# Altium schematic sheet 03_TILT_REF.SchDoc
size A4; SheetNumber: 3; SheetTotal: 6
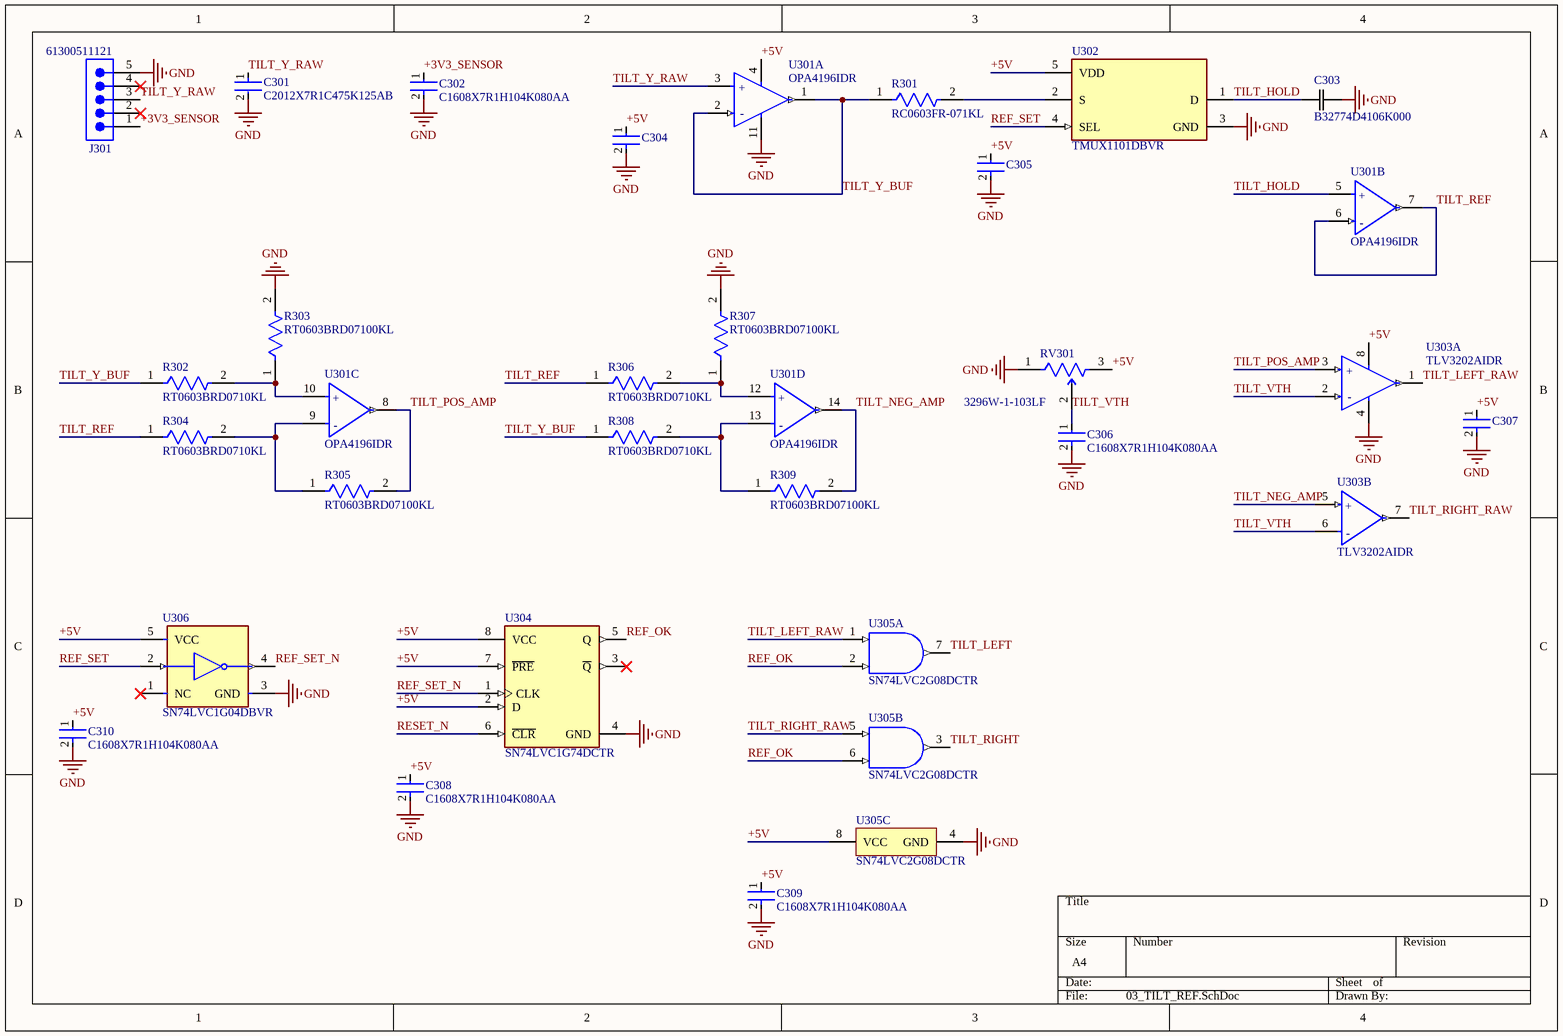
[diagram p0: 03_TILT_REF.SchDoc]

## Parts
C301  C2012X7R1C475K125AB  [FP-C2012-125-0_2-IPC_A]
C302  C1608X7R1H104K080AA  [FP-C1608-080-0_1-IPC_B]
C303  B32774D4106K000  [CAP_B32774D4106J000_TDK]
C304  C1608X7R1H104K080AA  [FP-C1608-080-0_1-IPC_B]  (value not drawn)
C305  C1608X7R1H104K080AA  [FP-C1608-080-0_1-IPC_B]  (value not drawn)
C306  C1608X7R1H104K080AA  [FP-C1608-080-0_1-IPC_B]
C307  C1608X7R1H104K080AA  [FP-C1608-080-0_1-IPC_B]  (value not drawn)
C308  C1608X7R1H104K080AA  [FP-C1608-080-0_1-IPC_B]
C309  C1608X7R1H104K080AA  [FP-C1608-080-0_1-IPC_B]
C310  C1608X7R1H104K080AA  [FP-C1608-080-0_1-IPC_B]
J301  61300511121  [61300511121]
R301  RC0603FR-071KL  [FP-RC0603-0_55-IPC_C]
R302  RT0603BRD0710KL  [FP-RT0603-MFG]
R303  RT0603BRD07100KL  [FP-RT0603-MFG]
R304  RT0603BRD0710KL  [FP-RT0603-MFG]
R305  RT0603BRD07100KL  [FP-RT0603-MFG]
R306  RT0603BRD0710KL  [FP-RT0603-MFG]
R307  RT0603BRD07100KL  [FP-RT0603-MFG]
R308  RT0603BRD0710KL  [FP-RT0603-MFG]
R309  RT0603BRD07100KL  [FP-RT0603-MFG]
RV301  3296W-1-103LF  [FP-3296W-MFG]
U301  OPA4196IDR  [FP-D0014A-IPC_A]  (parts A,B,C,D of 4)
U302  TMUX1101DBVR  [FP-DBV0005A-MFG]
U303  TLV3202AIDR  [FP-D0008A-IPC_B]  (parts A,B of 2)
U304  SN74LVC1G74DCTR  [FP-DCT0008A-MFG]
U305  SN74LVC2G08DCTR  [DCT0008A_M]  (parts A,B,C of 3)
U306  SN74LVC1G04DBVR  [FP-DBV0005A-MFG]

## Nets
GND: C301.2 C302.2 C303.2 C304.2 C305.2 C306.2 C307.2 C308.2 C309.2 C310.2 J301.5 R303.2 R307.2 RV301.1(CCW) U301.11(V-) U302.3(GND) U303.4(GND) U304.4(GND) U305.4(GND) U306.3(GND)
+3V3_SENSOR: C302.1 J301.1
+5V: C304.1 C305.1 C307.1 C308.1 C309.1 C310.1 RV301.3(CW) U301.4(V+) U302.5(VDD) U303.8(VCC) U304.2(D) U304.7(~{PRE}) U304.8(VCC) U305.8(VCC) U306.5(VCC)
REF_OK: U304.5(Q) U305.2(1B) U305.6(2B)
REF_SET: U302.4(SEL) U306.2(A)
REF_SET_N: U304.1(CLK) U306.4(Y)
RESET_N: U304.6(~{CLR})
TILT_HOLD: C303.1 U301.5(+IN_B) U302.1(D)
TILT_LEFT: U305.7(1Y)
TILT_LEFT_RAW: U303.1(1OUT) U305.1(1A)
TILT_NEG_AMP: R309.2 U301.14(OUT_D) U303.5(2IN+)
TILT_POS_AMP: R305.2 U301.8(OUT_C) U303.3(1IN+)
TILT_REF: R304.1 R306.1 U301.6(-IN_B) U301.7(OUT_B)
TILT_RIGHT: U305.3(2Y)
TILT_RIGHT_RAW: U303.7(2OUT) U305.5(2A)
TILT_VTH: C306.1 RV301.2(WIPER) U303.2(1IN-) U303.6(2IN-)
TILT_Y_BUF: R301.1 R302.1 R308.1 U301.1(OUT_A) U301.2(-IN_A)
TILT_Y_RAW: C301.1 J301.3 U301.3(+IN_A)
NetR301_2: R301.2 U302.2(S)
NetR302_2: R302.2 R303.1 U301.10(+IN_C)
NetR304_2: R304.2 R305.1 U301.9(-IN_C)
NetR306_2: R306.2 R307.1 U301.12(+IN_D)
NetR308_2: R308.2 R309.1 U301.13(-IN_D)

Not connected (* = marked no-connect by the designer): J301 2* 4*; U304 3(~{Q})*; U306 1(NC)*

## Notes on the sheet
- (in symbol CMP-04895-000120-1, part A) +; -
- (in symbol CMP-04895-000120-1, part B) +; -
- (in symbol CMP-04895-000120-1, part C) +; -
- (in symbol CMP-04895-000120-1, part D) +; -
- (in symbol CMP-04896-000095-1, part A) +; -
- (in symbol CMP-04896-000095-1, part B) +; -

## Library data of the parts
C301 = CMP-08246-006097-1: Multilayer Ceramic Capacitors 4.7μF ±10% 16V X7R SMD 0805; Capacitance: 4.7uF; Resistor Type: Ceramic; Series: C; Max Operating Temperature: 125°C; RoHS Compliant: Yes; Package Quantity: 1; Case/Package: 0805; Radiation Hardening: No; REACH SVHC: No SVHC; Width: 0.049inch; Min Operating Temperature: -55°C; Height: 1.25mm; Length: 2mm; Thickness: 0.057inch; Depth: 1.25mm; Packaging: Tape and Reel; Dielectric Material: Ceramic; Tolerance: 10%; Weight: 0.000194oz; Voltage Rating: 16V; Dielectric: X7R; Termination: SMD/SMT; Mount: Surface Mount; Case Code (Imperial): 0805; Lead Free: Lead Free; Number of Pins: 2; Construction: Flat; Case Code (Metric): 2012; Voltage Rating (DC): 16V
C302 C304-C310 = CMP-2000-04982-2: Multilayer Ceramic Capacitors 100nF ±10% 50V X7R SMD 0603; REACH SVHC: No SVHC; Voltage: 50V; Min Operating Temperature: -55°C; Package Quantity: 1; Case Code (Metric): 1608; Series: C; Termination: SMD/SMT; Length: 1.6mm; Voltage Rating: 50V; Case Code (Imperial): 0603; Number of Pins: 2; RoHS Compliant: Yes; Thickness: 0.037inch; Resistor Type: Ceramic; Radiation Hardening: No; Weight: 7.1E-05oz; Mount: Surface Mount; Capacitance: 100nF; Voltage Rating (DC): 50V; Construction: Flat; Tolerance: 10%; Lead Free: Lead Free; Case/Package: 0603; Max Operating Temperature: 125°C; Height: 0.8mm; Depth: 0.8mm; Packaging: Tape and Reel; Width: 0.031inch; Dielectric Material: Ceramic; Dielectric: X7R
C303 = B32774D4106K000: Description; Manufacturer_Name: TDK; Copyright: Copyright (C) 2025 Ultra Librarian. All rights reserved.; Manufacturer_Part_Number: B32774D4106K000
J301 = CMP-1502-01068-4: THT Vertical Pin Header WR-PHD, Pitch 2.54 mm, Single Row, 5 pins; Number of Contacts: 5; Connector Type: Male Pin; Operating Supply Voltage: 250V; Contact Resistance: 20mΩ; Gender: Male; Pitch: 2.54mm; Current Rating: 3A; Min Operating Temperature: -40°C; Contact Material: Gold; Color: Black; RoHS: Compliant; Number of Rows: 1; Lead Free: Lead Free; Height: 8.89mm; Contact Plating: Gold; Number of Pins: 5; Orientation: Vertical; Voltage Rating: 250V; Packaging: Bulk; Number of Positions: 5; Max Operating Temperature: 105°C; Termination: Solder; Lead Pitch: 2.54mm; Contact Mating Length: 5.9944mm; Mount: Through Hole
R301 = CMP-1659-00009-5: RES 1K OHM 1% 1/10W 0603; Resistance: 1kR; Voltage Rating: 50V; Power Rating: 100mW; Temperature Coefficient: 100ppm/°C; Military Standard: Not; REACH SVHC: No SVHC; Size Code: 0603; Features: Moisture Resistant; Number of Terminations: 2; Technology: THICK FILM; Series: RC; Case Code (Metric): 1608; Resistance Tolerance: 1%; Resistor Type: Thick Film; Termination: SMD/SMT; Contact Plating: Tin; Radiation Hardening: No; Min Operating Temperature: -55°C; Max Operating Temperature: 155°C; Packaging: Tape and Reel; Max Power Dissipation: 100mW; RoHS Compliant: Yes; Height: 0.45mm; Lead Free: Lead Free; Case/Package: 0603; Length: 1.6mm; Tolerance: 1%; Case Code (Imperial): 0603; Construction: Rectangular; Depth: 0.8mm
R302 R304 R306 R308 = CMP-03412-000619-1: RES 10.0K OHM 1/10W .1% SMD 0603; Manufacturer: Yageo; Resistance: 10KΩ; Value: 10KΩ; Tolerance: 0.001; Power Rating: 0.1W; Voltage Rating: 75V; Temperature Coefficient: 25 ppm/°C; Device Class L2: Resistors; Mouser Description: Thin Film Resistors - SMD 10K ohm 0.1% 1/10W; Digikey Description: RES 10.0K OHM 1/10W .1% SMD 0603; Temperature: -55°C to +155°C; Device Class L3: Chip SMD Resistors; Temperature Range Low: -55°C; Lead Free: Yes; Series: RT; ComponentLink2URL: http://www.yageo.com/documents/recent/PYu-RT_1-to-0.01_RoHS_L_9.pdf; Automotive: No; Ipc Land Pattern Name: RESC16080X45; Composition: Thin Film; Manufacturer Part Number: RT0603BRD0710KL; Footprint Url: http://www.yageo.com/exep/pages/download/literatures/PYu-R_Mount_10.pdf; Temperature Range High: +155°C; Device Class L1: Passive Components; Height: 0.55mm; Category: Res; Octopart: https://octopart.com/rt0603brd0710kl-yageo-1399221; Package: RT0603; RoHS: TRUE; ComponentLink2Description: Datasheet
R303 R305 R307 R309 = CMP-2000-04343-2: RES 100K OHM 1/10W .1% SMD 0603; Manufacturer: Yageo; Voltage Rating: 75V; Resistance: 100KΩ; Power Rating: 0.1W; Temperature Coefficient: 25 ppm/°C; Value: 100KΩ; Tolerance: 0.001; ComponentLink2URL: http://www.yageo.com/documents/recent/PYu-RT_1-to-0.01_RoHS_L_9.pdf; Device Class L1: Passive Components; Device Class L3: Chip SMD Resistors; Temperature: -55°C to +155°C; Temperature Range Low: -55°C; Temperature Range High: +155°C; Automotive: No; Series: RT; Device Class L2: Resistors; Digikey Description: RES 100K OHM 1/10W .1% SMD 0603; Composition: Thin Film; Height: 0.55mm; Lead Free: Yes; Manufacturer Part Number: RT0603BRD07100KL; Footprint Url: http://www.yageo.com/exep/pages/download/literatures/PYu-R_Mount_10.pdf; Octopart: https://octopart.com/rt0603brd07100kl-yageo-1402588; Category: Res; ComponentLink2Description: Datasheet; Ipc Land Pattern Name: RESC16080X45; Package: RT0603; RoHS: TRUE; Mouser Description: Resistor; Resistance: 100Kohm; Resistance Tolerance: ± 1%; Resistor Element Material:
RV301 = CMP-1747-00001-8: TRIMMER 10K OHM 0.5W PC PIN TOP; Number of Turns: 25; Tolerance: 10%; Resistance: 10kR; Max Power Dissipation: 500mW; Temperature Coefficient: 100ppm/°C; Insulation Resistance: 1GR; Min Operating Temperature: -55°C; Resistor Type: Cermet; Series: 3296; Color: Blue; Mount: Through Hole; Taper: Linear; Radiation Hardening: No; RoHS Compliant: Yes; Width: 9.53mm; Resistance Tolerance: 10%; Contact Plating: Tin; Military Standard: Not; Package Quantity: 50; Weight: 0.03oz; Lead Free: Lead Free; Power Rating: 500mW; Termination: Pin; Technology: CERMET; Max Operating Temperature: 125°C; Packaging: Rail/Tube; Length: 9.53mm; Depth: 4.83mm; Height: 11.55mm; Reach SVHC Compliant: Yes
U301 = CMP-04895-000120-1: IC OPAMP GP 4 CIRCUIT 14SOIC; Gain Bandwidth Product: 2.5MHz; Operating Supply Current: 140uA; Input Offset Voltage (Vos): 100uV; Input Bias Current: 20pA; Number of Channels: 4; Slew Rate: 7V/µs; Mount: Surface Mount; Packaging: Tape and Reel; Max Operating Temperature: 125°C; Case/Package: SOIC; Number of Circuits: 4; Number of Pins: 14; RoHS Compliant: Yes; Min Operating Temperature: -40°C
U302 = CMP-00370-99888634-1: TMUX1101DBVR 3-pA on-state leakage current, 5-V, 1: 1 (SPST), 1-channel precision switch (active high) 5-SOT-23 -40 to 125; Resistance: 4.9Ω; Number of Channels: 1; Thickness: 1.2mm; Manufacturer Lifecycle Status: ACTIVE; Width: 1.6mm; Lifecycle Status: Production; Schedule B: 8542390000; Height: 1.45mm; Case/Package: SOT-23; NexarPartId: 99888634; Number of Pins: 5; Length: 2.9mm
U303 = CMP-04896-000095-1: IC COMPARATOR RRI DUAL 8SOIC; Power Supply Rejection Ratio (PSRR): 85dB; Output Type: PUSH-PULL; Number of Channels: 2; Propagation Delay: 50ns; Input Bias Current: 50pA; Hysteresis: 1.2mV; Common Mode Rejection Ratio: 70dB; Max Supply Current: 40uA; Response Time: 0.047us; Max Supply Voltage: 5.5V; Quiescent Current: 50uA; Min Supply Voltage: 2.7V; Input Offset Voltage (Vos): 5mV; Number of Pins: 8; Series: TLV3202; Type: General Purpose; Max Operating Temperature: 125°C; Packaging: Tape and Reel; Mount: Surface Mount; Max Input Current: 50pA; RoHS Compliant: Yes; Package Quantity: 2500; Case/Package: SOIC; Radiation Hardening: No; Contact Plating: Gold; Min Operating Temperature: -40°C; Number of Elements: 2; Lead Free: Lead Free; Supply Current: 50uA; Nominal Supply Current: 50uA
U304 = CMP-0859-00550-4: IC FF D-TYPE SNGL 1BIT SM8; Manufacturer: Texas Instruments; Propagation Delay: 6.4ns; Logic Function Desc: D Type; Frequency: 200MHz; Standoff Height: 0mm; Max Supply Voltage: 5.5V; Min Supply Voltage: 1.65V; Number Of Circuits: 1; Number Of Outputs: 2; Nominal Supply Current: 10uA; Manufacturer Part Number: SN74LVC1G74DCTR; Ambient Temperature Range High: +125°C; ComponentLink2Description: Datasheet; Device Class L2: Logic ICs; Digikey Description: IC FF D-TYPE SNGL 1BIT SM8; Height: 1.3mm; ComponentLink2URL: http://www.ti.com/lit/ds/symlink/sn74lvc1g74.pdf; Device Class L3: Latches and Flip Flops; Temperature: -40°C to +125°C; Ipc Land Pattern Name: SOP65P400X130-8; Lead Free: Yes; Octopart: https://octopart.com/sn74lvc1g74dctr-texas+instruments-12194016; Package: DCT0008A; Temperature Range Low: -40°C; Ambient Temperature Range Low: -40°C; Temperature Range High: +125°C; Category: IC; Device Class L1: Integrated Circuits (ICs); Mouser Description: Flip Flops Sgl Pos-Edge-Trggrd; RoHS: TRUE; Number Of Inputs: 1; Automotive: No
U305 = CMP-0859-00527-3: Dual 2-Input Positive-AND Gate, DCT0008A, LARGE T&R; Manufacturer: Texas Instruments; VCC(Max)(V): 5.5; Technology Family: LVC; Voltage(Nom)(V): 1.8,2.5,3.3,5; Input Type: CMOS/TTL; VCC(Min)(V): 1.65; Rating: Catalog; Output Type: CMOS; tpd @ Nom Voltage(Max)(ns): 9.8,5.8,5.3,4.8; Bits(#): 2; Gate Type: AND; 3-State Output: No; Output Drive (IOL/IOH)(Max)(mA): 32/-32; ICC @ Nom Voltage(Max)(mA): 0.01; Logic: True; F @ Nom Voltage(Max)(Mhz): 150; Operating Temperature Range(C): -40 to 125,-40 to 85; DatasheetVersion: SCES198M; Sub-Family: AND Gate; Schmitt Trigger: No; Generic Part Number: SN74LVC2G08; PackageReference: DCT0008A
U306 = CMP-0859-00134-4: IC INVERTER 1CH 1-INP SOT23-5; Number of Elements: 1; Turn-On Delay Time: 7.5ns; Propagation Delay: 3.7ns; Max Supply Voltage: 5.5V; Max Output Current: 32mA; Quiescent Current: 10uA; High Level Output Current: -32mA; Schmitt Trigger Input: No; Min Supply Voltage: 1.65V; Number of Circuits: 1; Lead Free: Lead Free; Number of Inputs: 1; Mount: Surface Mount; Length: 3.05mm; Width: 1.75mm; Number of Pins: 5; Case/Package: SOT-23; REACH SVHC: No SVHC; Low Level Output Current: 32mA; Package Quantity: 1; Height: 1.3mm; Radiation Hardening: No; Packaging: Tape and Reel; Output Current: 32mA; Max Operating Temperature: 125°C; Termination: SMD/SMT; Min Operating Temperature: -40°C; Number of Gates: 1; Weight: 0.000557oz; Logic Function: Inverter; Number of Bits: 1; Contact Plating: Tin